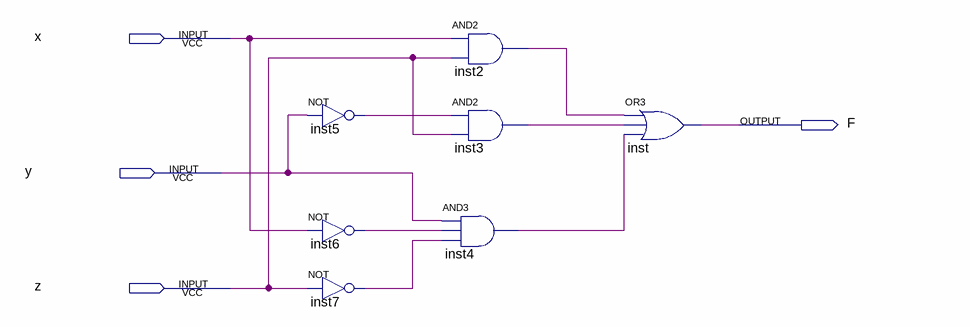
[diagram p0: schematic sheet]
// Quartus schematic project1.bdf as structural Verilog: 7 symbols, 4 pins
module project1 (
  input  x,
  input  y,
  input  z,
  output F
);

  wire inst2_out, inst3_out, inst4_out, inst5_out, inst6_out, inst7_out;

  not inst5 (inst5_out, y);
  not inst6 (inst6_out, x);
  not inst7 (inst7_out, z);
  and inst2 (inst2_out, x, z);
  and inst3 (inst3_out, inst5_out, z);
  and inst4 (inst4_out, y, inst6_out, inst7_out);
  or inst (F, inst2_out, inst3_out, inst4_out);
endmodule
